# Altium schematic sheet LD_driver.SchDoc
size 420 x 297 mm; Address1: Address1; Address2: Address2; Address3: Address3; Address4: Address4; DocumentNumber: *Э3; SheetNumber: 5; SheetTotal: 11; DocumentType: Схема электрическая *
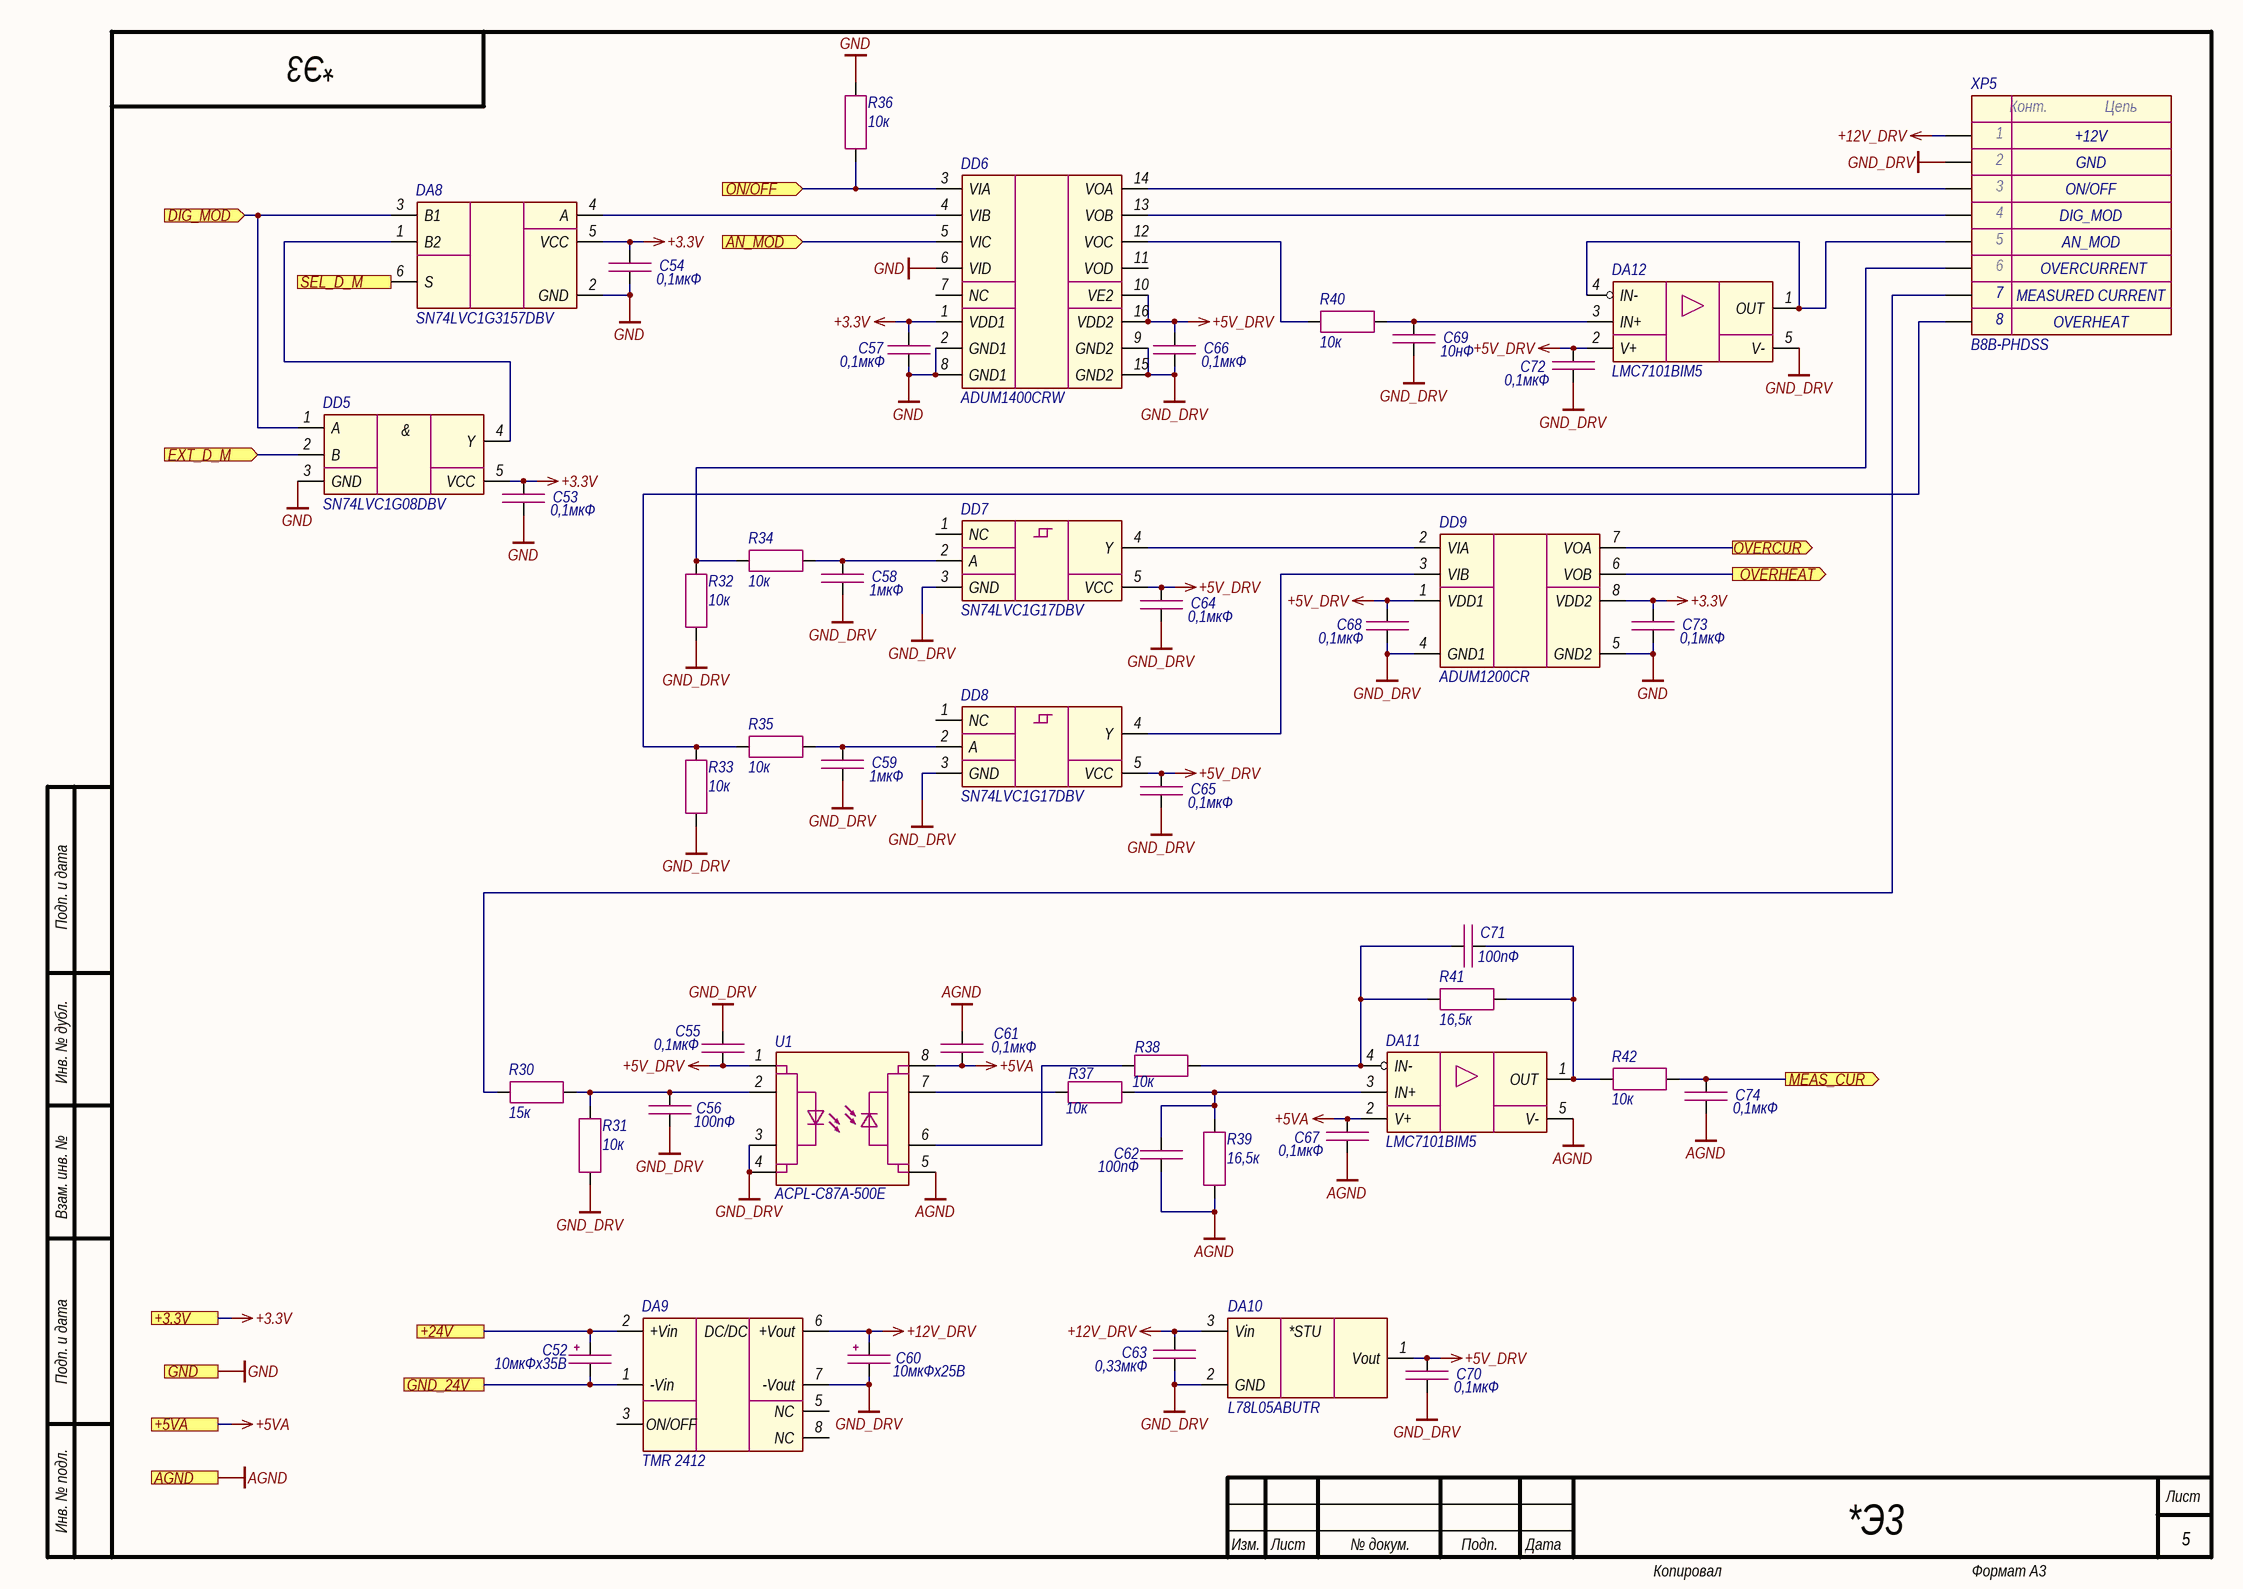
[diagram p0: LD_driver.SchDoc]

## Parts
C52  10мкФх35B  [CAP_C]
C53  0,1мкФ  [CAP_0603]
C54  0,1мкФ  [CAP_0603]
C55  0,1мкФ  [CAP_0603]
C56  100пФ  [CAP_0603]
C57  0,1мкФ  [CAP_0603]
C58  1мкФ  [CAP_0603]
C59  1мкФ  [CAP_0603]
C60  10мкФх25B  [CAP_B]
C61  0,1мкФ  [CAP_0603]
C62  100пФ  [CAP_0603]
C63  0,33мкФ  [CAP_0805]
C64  0,1мкФ  [CAP_0603]
C65  0,1мкФ  [CAP_0603]
C66  0,1мкФ  [CAP_0603]
C67  0,1мкФ  [CAP_0603]
C68  0,1мкФ  [CAP_0603]
C69  10нФ  [CAP_0603]
C70  0,1мкФ  [CAP_0603]
C71  100пФ  [CAP_0603]
C72  0,1мкФ  [CAP_0603]
C73  0,1мкФ  [CAP_0603]
C74  0,1мкФ  [CAP_0603]
DA8  SN74LVC1G3157DBV  [SOT-23-6]
DA9  TMR 2412  [TMR3 (SIP-8)]
DA10  L78L05ABUTR  [SOT-89]
DA11  LMC7101BIM5  [SOT-23-5]
DA12  LMC7101BIM5  [SOT-23-5]
DD5  SN74LVC1G08DBV  [SOT-23-5]
DD6  ADUM1400CRW  [SOIC-16W]
DD7  SN74LVC1G17DBV  [SOT-23-5]
DD8  SN74LVC1G17DBV  [SOT-23-5]
DD9  ADUM1200CR  [SOIC-8]
R30  15к  [RES_0603]
R31  10к  [RES_0603]
R32  10к  [RES_0603]
R33  10к  [RES_0603]
R34  10к  [RES_0603]
R35  10к  [RES_0603]
R36  10к  [RES_0603]
R37  10к  [RES_0603]
R38  10к  [RES_0603]
R39  16,5к  [RES_0603]
R40  10к  [RES_0603]
R41  16,5к  [RES_0603]
R42  10к  [RES_0603]
U1  ACPL-C87A-500E  [SSO-8]
XP5  B8B-PHDSS  [B8B-PHDSS]

## Ports
+3.3V (see Main[2C], Ethernet[3D], Fiber_interlock[2C], Flow_sensor[2C], Hardwiring[3D], Power_supply[1D]), +5VA (see Main[2C], Hardwiring[4D], Photodiode[1C]), +24V (see Main[1C], Flow_sensor[2C], Hardwiring[3C], Indication[1C], Power_supply[1D]), AGND (see Main[2C], Hardwiring[4D], Photodiode[1D], Thermistor[2C]), AN_MOD (in, see Main[1C]), DIG_MOD (in, see Main[1C]), EXT_D_M (in, see Main[1C]), GND (see Main[2C], Ethernet[3D], Fiber_interlock[2C], Flow_sensor[2C], Guide_laser[1C], Hardwiring[3D], Indication[1C], Power_supply[1D]), GND_24V (see Main[1C], Flow_sensor[2C], Hardwiring[3C], Indication[1C], Power_supply[1D]), MEAS_CUR (out, see Main[2C]), ON/OFF (in, see Main[1C]), OVERCUR (out, see Main[2C]), OVERHEAT (out, see Main[2C]), SEL_D_M (in, see Main[1C])

## Nets
+3.3V: C53.1 C54.1 C57.1 C73.1 DA8.5(VCC) DD5.5(VCC) DD6.1(VDD1) DD9.8(VDD2) ; port +3.3V
+5V_DRV: C55.1 C64.1 C65.1 C66.1 C68.1 C70.1 C72.1 DA10.1(Vout) DA12.2(V+) DD6.10(VE2) DD6.16(VDD2) DD7.5(VCC) DD8.5(VCC) DD9.1(VDD1) U1.1(VDD1)
+5VA: C61.1 C67.1 DA11.2(V+) U1.8(VDD2) ; port +5VA
+12V_DRV: C60.1 C63.2 DA9.6(+Vout) DA10.3(Vin) XP5.1
AGND: C61.2 C62.2 C67.2 C74.2 DA11.5(V-) R39.2 U1.5(GND2) ; port AGND
GND: C53.2 C54.2 C57.2 C73.2 DA8.2(GND) DD5.3(GND) DD6.2(GND1) DD6.6(VID) DD6.8(GND1) DD9.5(GND2) R36.1 ; port GND
GND_DRV: C55.2 C56.1 C58.2 C59.2 C60.2 C63.1 C64.2 C65.2 C66.2 C68.2 C69.2 C70.2 C72.2 DA9.7(-Vout) DA10.2(GND) DA12.5(V-) DD6.9(GND2) DD6.15(GND2) DD7.3(GND) DD8.3(GND) DD9.4(GND1) R31.2 R32.1 R33.1 U1.3(SHDN) U1.4(GND1) XP5.2
+24V: C52.1 DA9.2(+Vin) ; port +24V
AN_MOD: DD6.5(VIC) ; port AN_MOD
DIG_MOD: DA8.3(B1) DD5.1(A) ; port DIG_MOD
EXT_D_M: DD5.2(B) ; port EXT_D_M
GND_24V: C52.2 DA9.1(-Vin) ; port GND_24V
MEAS_CUR: C74.1 R42.2 ; port MEAS_CUR
ON/OFF: DD6.3(VIA) R36.2 ; port ON/OFF
OVERCUR: DD9.7(VOA) ; port OVERCUR
OVERHEAT: DD9.6(VOB) ; port OVERHEAT
SEL_D_M: DA8.6(S) ; port SEL_D_M
NetC56_2: C56.2 R30.1 R31.1 U1.2(VIN)
NetC58_1: C58.1 DD7.2(A) R34.2
NetC59_1: C59.1 DD8.2(A) R35.2
NetC62_1: C62.1 DA11.3(IN+) R37.2 R39.1
NetC69_1: C69.1 DA12.3(IN+) R40.2
NetC71_1: C71.1 DA11.4(IN-) R38.2 R41.2
NetC71_2: C71.2 DA11.1(OUT) R41.1 R42.1
NetDA8_1: DA8.1(B2) DD5.4(Y)
NetDA8_4: DA8.4(A) DD6.4(VIB)
NetDA12_1: DA12.1(OUT) DA12.4(IN-) XP5.5
NetDD6_12: DD6.12(VOC) R40.1
NetDD6_13: DD6.13(VOB) XP5.4
NetDD6_14: DD6.14(VOA) XP5.3
NetDD7_4: DD7.4(Y) DD9.2(VIA)
NetDD8_4: DD8.4(Y) DD9.3(VIB)
NetR30_2: R30.2 XP5.7
NetR32_2: R32.2 R34.1 XP5.6
NetR33_2: R33.2 R35.1 XP5.8
NetR37_1: R37.1 U1.7(VOUT+)
NetR38_1: R38.1 U1.6(VOUT-)

Not connected (* = marked no-connect by the designer): DA9 3(ON/OFF) 5(NC) 8(NC); DD6 7(NC) 11(VOD); DD7 1(NC); DD8 1(NC)

## Notes on the sheet
- ON/OFF
- +12V
- GND
- AN_MOD
- DIG_MOD
- OVERHEAT
- (near XP5) MEASURED CURRENT
- OVERCURRENT
- Подп. и дата
- Инв. № дубл.
- Взам. инв. №
- Инв. № подл.
- Изм.
- Лист
- № докум.
- Подп.
- Дата
- Копировал
- Формат А3
- (in symbol Connector-8) Конт.; Цепь
- (in symbol LD2981ABU50TR) *STU
- (in symbol SN74LVC1G08) &
- (in symbol TMR3) DC/DC

## Library data of the parts
C52 = Capacitor_Polar: Model: TECAP, 10 мкФ, 35 В, тип C, 10%; Value: 10мкФх35B; Document: *; Manufacturer: *
C53-C55 C57 C61 C64-C68 C70 C72-C74 = Capacitor: Manufacturer: Murata; Model: GRM188R71H104KA93D; Value: 0,1мкФ; Document: *
C56 C62 C71 = Capacitor: Manufacturer: Murata; Model: GRM1885C1H101JA01D; Value: 100пФ; Document: *
C58 C59 = Capacitor: Manufacturer: Murata; Model: GRM188R61H105KAALD; Value: 1мкФ; Document: *
C60 = Capacitor_Polar: Model: TECAP, 10 мкФ, 25 В, тип B, 10%; Value: 10мкФх25B; Document: *; Manufacturer: *
C63 = Capacitor: Manufacturer: Murata; Model: GRM219R71H334KA88D; Value: 0,33мкФ; Document: *
C69 = Capacitor: Manufacturer: Murata; Model: GRM188R71H103JA01D; Value: 10нФ; Document: *
DA8 = SN74LVC1G3157: Manufacturer: Texas Instruments; Model: SN74LVC1G3157DBV; Document: *
DA9 = TMR3: Manufacturer: Traco Power; Model: TMR 2412; Document: *
DA10 = LD2981ABU50TR: Manufacturer: STMicroelectronics; Model: L78L05ABUTR; Document: *
DA11 DA12 = LMC7101: Manufacturer: Texas Instruments; Model: LMC7101BIM5; Document: *
DD5 = SN74LVC1G08: Manufacturer: Texas Instruments; Model: SN74LVC1G08DBV; Document: *
DD6 = ADUM1400: Manufacturer: Analog Devices; Model: ADUM1400CRW; Document: *
DD7 DD8 = SN74LVC1G17: Manufacturer: Texas Instruments; Model: SN74LVC1G17DBV; Document: *
DD9 = ADUM1200: Manufacturer: Analog Devices; Model: ADUM1200CR; Document: *
R30 = Resistor: Manufacturer: Yageo; Model: RC0603FR-0715KL; Value: 15к; Document: *
R31-R38 R40 R42 = Resistor: Manufacturer: Yageo; Model: RC0603FR-0710KL; Value: 10к; Document: *
R39 R41 = Resistor: Manufacturer: Yageo; Model: RC0603FR-0716K5L; Value: 16,5к; Document: *
U1 = ACPL-C87: Manufacturer: Broadcom; Model: ACPL-C87A-500E
XP5 = Connector-8: Manufacturer: JST; Model: B8B-PHDSS; Document: *